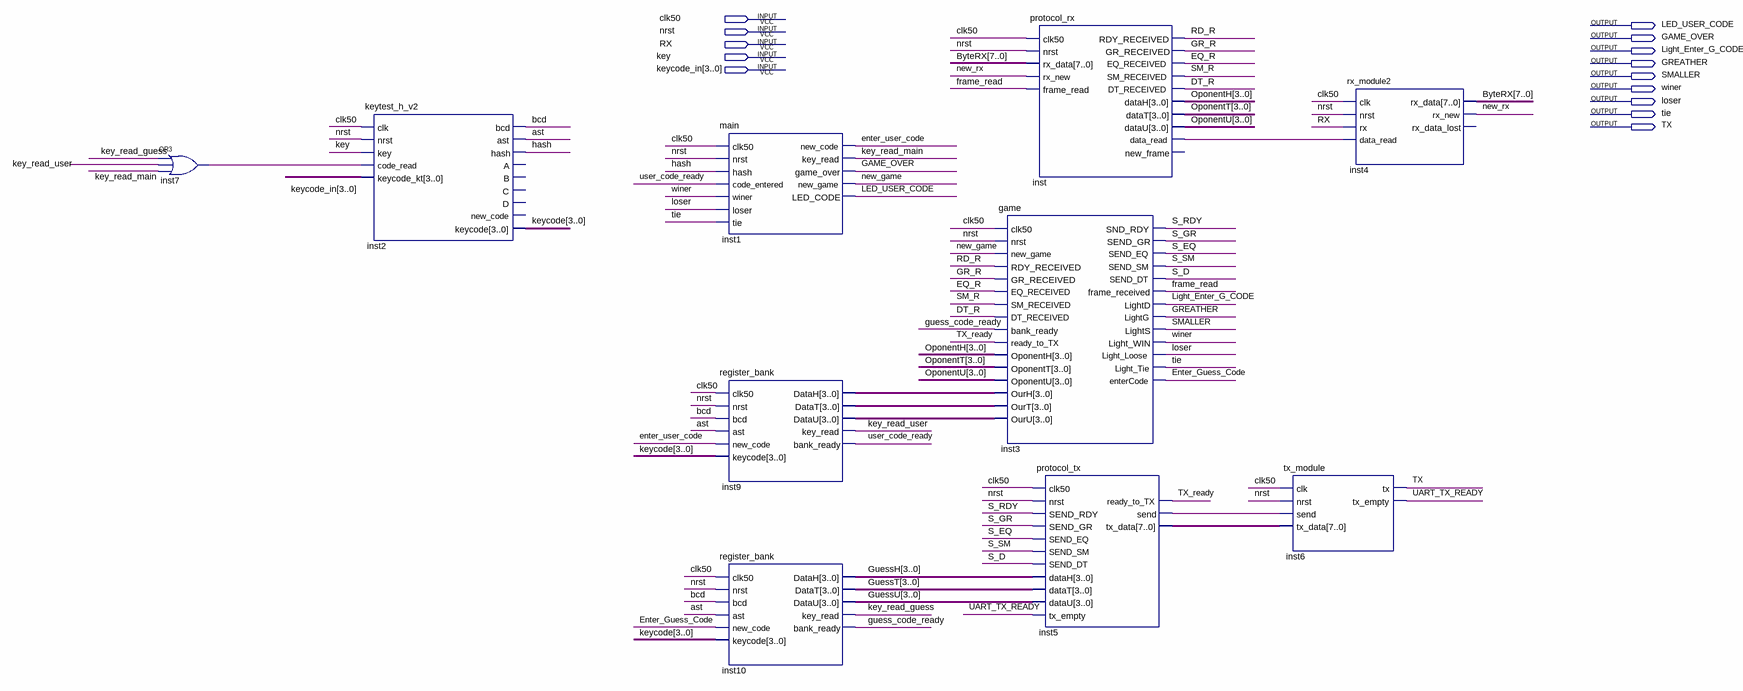
[diagram p0: schematic sheet]
// Quartus schematic practice1_3.bdf as structural Verilog: 10 symbols, 14 pins
module practice1_3 (
  input  clk50,
  input  nrst,
  input  RX,
  input  key,
  input  [3:0] keycode_in,
  output LED_USER_CODE,
  output GAME_OVER,
  output Light_Enter_G_CODE,
  output GREATHER,
  output SMALLER,
  output winer,
  output loser,
  output tie,
  output TX
);

  wire ast, bcd, DT_R, Enter_Guess_Code, enter_user_code, EQ_R, frame_read, GR_R, guess_code_ready, hash,
       inst5_send, inst7_out, inst_data_read, key_read_guess, key_read_main, key_read_user, new_game, new_rx,
       RD_R, S_D, S_EQ, S_GR, S_RDY, S_SM, SM_R, TX_ready, UART_TX_READY, user_code_ready;
  wire [3:0] GuessH, GuessT, GuessU, inst9_datah, inst9_datat, inst9_datau, keycode, OponentH, OponentT,
       OponentU;
  wire [7:0] ByteRX, inst5_tx_data;

  or inst7 (inst7_out, key_read_guess, key_read_user, key_read_main);
  keytest_h_v2 inst2 (
    .clk(clk50), .nrst(nrst), .key(key), .code_read(inst7_out), .keycode_kt(keycode_in), .bcd(bcd),
    .ast(ast), .hash(hash), .keycode(keycode));  // open: A, B, C, D, new_code
  main inst1 (
    .clk50(clk50), .nrst(nrst), .hash(hash), .code_entered(user_code_ready), .winer(winer), .loser(loser),
    .tie(tie), .new_code(enter_user_code), .key_read(key_read_main), .game_over(GAME_OVER),
    .new_game(new_game), .LED_CODE(LED_USER_CODE));
  register_bank inst9 (
    .clk50(clk50), .nrst(nrst), .bcd(bcd), .ast(ast), .new_code(enter_user_code), .keycode(keycode),
    .DataH(inst9_datah), .DataT(inst9_datat), .DataU(inst9_datau), .key_read(key_read_user),
    .bank_ready(user_code_ready));
  register_bank inst10 (
    .clk50(clk50), .nrst(nrst), .bcd(bcd), .ast(ast), .new_code(Enter_Guess_Code), .keycode(keycode),
    .DataH(GuessH), .DataT(GuessT), .DataU(GuessU), .key_read(key_read_guess), .bank_ready(guess_code_ready));
  game inst3 (
    .clk50(clk50), .nrst(nrst), .new_game(new_game), .RDY_RECEIVED(RD_R), .GR_RECEIVED(GR_R),
    .EQ_RECEIVED(EQ_R), .SM_RECEIVED(SM_R), .DT_RECEIVED(DT_R), .bank_ready(guess_code_ready),
    .ready_to_TX(TX_ready), .OponentH(OponentH), .OponentT(OponentT), .OponentU(OponentU),
    .OurH(inst9_datah), .OurT(inst9_datat), .OurU(inst9_datau), .SND_RDY(S_RDY), .SEND_GR(S_GR),
    .SEND_EQ(S_EQ), .SEND_SM(S_SM), .SEND_DT(S_D), .frame_received(frame_read), .LightD(Light_Enter_G_CODE),
    .LightG(GREATHER), .LightS(SMALLER), .Light_WIN(winer), .Light_Loose(loser), .Light_Tie(tie),
    .enterCode(Enter_Guess_Code));
  protocol_rx inst (
    .clk50(clk50), .nrst(nrst), .rx_data(ByteRX), .rx_new(new_rx), .frame_read(frame_read),
    .RDY_RECEIVED(RD_R), .GR_RECEIVED(GR_R), .EQ_RECEIVED(EQ_R), .SM_RECEIVED(SM_R), .DT_RECEIVED(DT_R),
    .dataH(OponentH), .dataT(OponentT), .dataU(OponentU), .data_read(inst_data_read));  // open: new_frame
  protocol_tx inst5 (
    .clk50(clk50), .nrst(nrst), .SEND_RDY(S_RDY), .SEND_GR(S_GR), .SEND_EQ(S_EQ), .SEND_SM(S_SM),
    .SEND_DT(S_D), .dataH(GuessH), .dataT(GuessT), .dataU(GuessU), .tx_empty(UART_TX_READY),
    .tx_data(inst5_tx_data), .ready_to_TX(TX_ready), .send(inst5_send));
  tx_module inst6 (
    .clk(clk50), .nrst(nrst), .send(inst5_send), .tx_data(inst5_tx_data), .tx(TX), .tx_empty(UART_TX_READY));
  rx_module2 inst4 (
    .clk(clk50), .nrst(nrst), .rx(RX), .data_read(inst_data_read), .rx_data(ByteRX), .rx_new(new_rx));  // open: rx_data_lost
endmodule
